# Altium project MiniEink 1.54寸墨水屏.PrjPcb
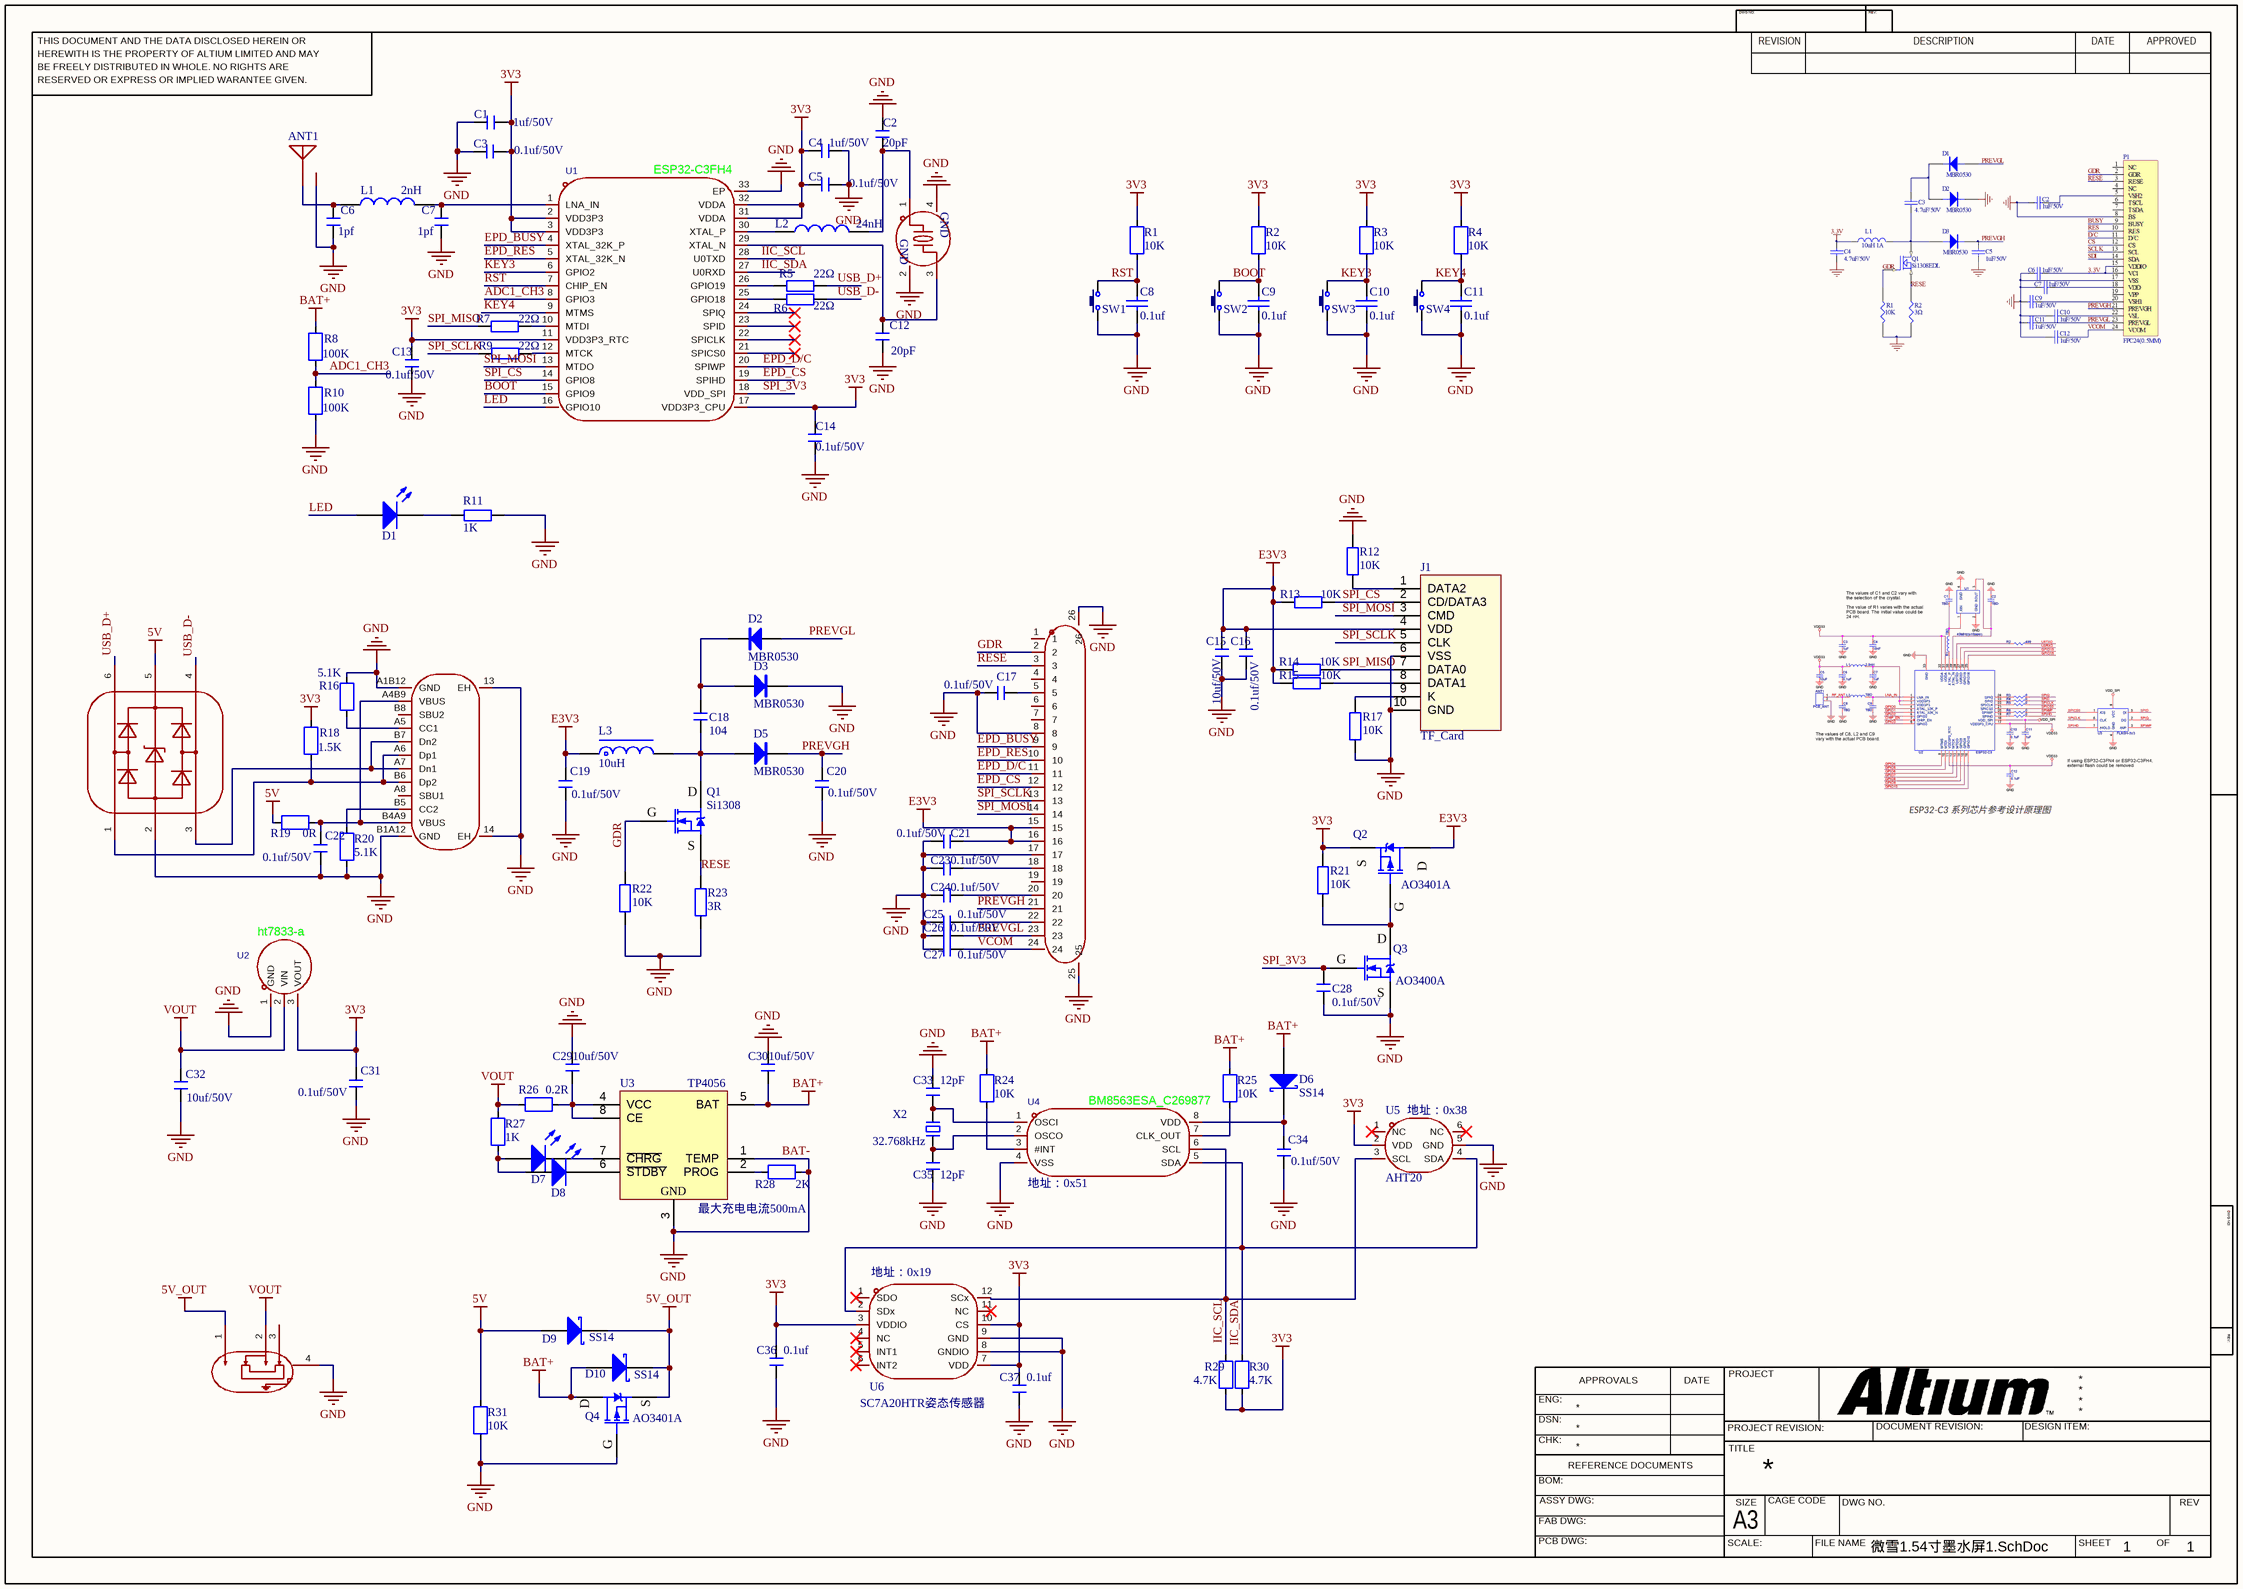
[diagram p0: 微雪1.54寸墨水屏1.SchDoc]
1 sheet, 102 parts. Net scope: global (net labels, ports and power ports of the same name join across sheets).
Board file: MiniEink 1.54寸墨水屏.PcbDoc

## Sheet 微雪1.54寸墨水屏1.SchDoc
size 420 x 297 mm; SheetNumber: 1; SheetTotal: 1

### Parts
ANT1  ANT2  [(my)ANT-F-1-2.4G-1.6mmFR4-WCH]  (value not drawn)
C1  1uf/50V  [C 0603_L]
C2  20pF  [C 0603_L]
C3  0.1uf/50V  [C 0603_L]
C4  1uf/50V  [C 0603_L]
C5  0.1uf/50V  [C 0603_L]
C6  1pf  [C 0603_L]
C7  1pf  [C 0603_L]
C8  value 0.1uf  [C 0603_L]  (hidden comment: 0.1uf/50V)
C9  value 0.1uf  [C 0603_L]  (hidden comment: 0.1uf/50V)
C10  value 0.1uf  [C 0603_L]  (hidden comment: 0.1uf/50V)
C11  value 0.1uf  [C 0603_L]  (hidden comment: 0.1uf/50V)
C12  20pF  [C 0603_L]
C13  0.1uf/50V  [C 0603_L]
C14  0.1uf/50V  [C 0603_L]
C15  10uf/50V  [C 0805_L]
C16  0.1uf/50V  [C 0603_L]
C17  0.1uf/50V  [C 0603_L]
C18  104  [C 0805_L]
C19  0.1uf/50V  [C 0603_L]
C20  0.1uf/50V  [C 0603_L]
C21  0.1uf/50V  [C 0603_L]
C22  0.1uf/50V  [C 0603_L]
C23  0.1uf/50V  [C 0603_L]
C24  0.1uf/50V  [C 0603_L]
C25  0.1uf/50V  [C 0603_L]
C26  0.1uf/50V  [C 0603_L]
C27  0.1uf/50V  [C 0603_L]
C28  0.1uf/50V  [C 0603_L]
C29  10uf/50V  [C 0805_L]
C30  10uf/50V  [C 0805_L]
C31  0.1uf/50V  [C 0603_L]
C32  10uf/50V  [C 0805_L]
C33  12pF  [C 0603_L]
C34  0.1uf/50V  [C 0603_L]
C35  12pF  [C 0603_L]
C36  0.1uf  [C 0603_L]
C37  0.1uf  [C 0603_L]
D1  LED  [LED 0603R]  (value not drawn)
D2  MBR0530  [SOD-123]
D3  MBR0530  [SOD-123]
D4  USBLC6-2SC6  [SOT23-6L]  (value not drawn)
D5  MBR0530  [SOD-123]
D6  SS14  [SOD-123F]
D7  LED  [LED 0603R]  (value not drawn)
D8  LED  [LED 0603G]  (value not drawn)
D9  SS14  [SOD-123F]
D10  SS14  [SOD-123F]
FPC1  FPC-05F-24PH20  [AFC07-S24ECA-00]  (value not drawn)
J1  TF_Card  [Micro SD 3D]
L1  2nH  [L 0603]
L2  24nH  [L 0603]
L3  10uH  [CD31]
Q1  Si1308  [SOT323]
Q2  AO3401A  [SOT23-3N]
Q3  AO3400A  [SOT23-3N]
Q4  AO3401A  [SOT23-3N]
R1  10K  [R 0603_L]
R2  10K  [R 0603_L]
R3  10K  [R 0603_L]
R4  10K  [R 0603_L]
R5  22Ω  [R 0603_L]
R6  22Ω  [R 0603_L]
R7  22Ω  [R 0603_L]
R8  100K  [R 0603_L]
R9  22Ω  [R 0603_L]
R10  100K  [R 0603_L]
R11  1K  [R 0805_L]
R12  10K  [R 0603_L]
R13  10K  [R 0603_L]
R14  10K  [R 0603_L]
R15  10K  [R 0603_L]
R16  5.1K  [R 0603_L]
R17  10K  [R 0603_L]
R18  1.5K  [R 0603_L]
R19  0R  [R 0603_L]
R20  5.1K  [R 0603_L]
R21  10K  [R 0603_L]
R22  10K  [R 0603_L]
R23  3R  [R 0805_L]
R24  10K  [R 0603_L]
R25  10K  [R 0603_L]
R26  0.2R  [R 0603_L]
R27  1K  [R 0603_L]
R28  2K  [R 0603_L]
R29  4.7K  [R 0603_L]
R30  4.7K  [R 0603_L]
R31  10K  [R 0603_L]
SW1  3x6x5  [TSW SMD-3*6*2.5]  (value not drawn)
SW2  3x6x5  [SW-SMD_L6.0-W6.0-LS6.6]  (value not drawn)
SW3  3x6x5  [SW-SMD_L6.0-W6.0-LS6.6]  (value not drawn)
SW4  3x6x5  [SW-SMD_L6.0-W6.0-LS6.6]  (value not drawn)
SW5  MSK12C02  [SW-TH_MSK12C02]  (value not drawn)
U1  ESP32-C3FH4  [QFN-32_L5.0-W5.0-P0.50-TL-EP3.7]
U2  ht7833-a  [SOT89_L]
U3  TP4056  [ESOP8_L]
U4  BM8563ESA_C269877  [SOP8_L]
U5  AHT20  [SENSOR-SMD_L3.0-W3.0-P1.00-BR]
U6  SC7A20HTR  [LGA-12_L2.0-W2.0-P0.50-TL]  (value not drawn)
USB1  TYPE-C 16PIN 2MD(073)  [USB-C-SMD_TYPE-C-16PIN-2MD-073]  (value not drawn)
X1  XL2EL89CPI-111YLC-40M  [SMD3225-4P]  (value not drawn)
X2  32.768kHz  [OSC 3215-2P]

### Nets
3V3: C1.2 C3.2 C4.1 C5.1 C13.2 C14.2 C31.2 C36.2 C37.2 Q2.2(S) R1.1 R2.1 R3.1 R4.1 R18.1 R21.2 R29.1 R30.2 U1.2(VDD3P3) U1.3(VDD3P3) U1.11(VDD3P3_RTC) U1.17(VDD3P3_CPU) U1.31(VDDA) U1.32(VDDA) U2.3(VOUT) U5.2(VDD) U6.3(VDDIO) U6.7(VDD) U6.10(CS)
5V: D4.5 D9.1(A) R19.2 R31.1
5V_OUT: D9.2(K) D10.2(K) Q4.2(S) SW5.1
BAT+: C30.1 D6.1(A) D10.1(A) Q4.3(D) R8.1 R24.1 R25.1 U3.5(BAT)
BAT-: ANT1.2 C1.1 C2.1 C3.1 C4.2 C5.2 C6.2 C7.2 C8.1 C9.1 C10.1 C11.1 C12.1 C13.1 C14.1 C15.2 C16.2 C17.2 C19.1 C20.1 C21.2 C22.1 C23.2 C24.2 C25.2 C26.2 C27.2 C28.2 C29.2 C30.2 C31.1 C32.1 C33.2 C34.1 C35.1 C36.1 C37.1 D3.2(K) D4.2 FPC1.8 FPC1.17 FPC1.25 FPC1.26 J1.6(VSS) J1.10(GND) Q3.3(S) Q4.1(G) R10.2 R11.2 R12.1 R16.1 R17.1 R20.1 R22.1 R23.1 R28.2 R31.2 SW1.1 SW2.1 SW3.1 SW4.1 SW5.4 U1.33(EP) U2.1(GND) U3.1(TEMP) U3.3(GND) U4.4(VSS) U5.5(GND) U6.8(GNDIO) U6.9(GND) USB1.13(EH) USB1.14(EH) USB1.A1B12(GND) USB1.B1A12(GND) X1.2(GND) X1.4(GND)  [also labelled GND]
E3V3: C15.1 C16.1 C19.2 C21.1 FPC1.15 FPC1.16 J1.4(VDD) L3.1 Q2.3(D) R13.2 R14.2 R15.1
VOUT: C32.2 R26.1 R27.2 SW5.2 U2.2(VIN)
ADC1_CH3: R8.2 R10.1 U1.8(GPIO3)
BOOT: C9.2 R2.2 SW2.2 U1.15(GPIO9)
EPD_BUSY: FPC1.9 U1.4(XTAL_32K_P)
EPD_CS: FPC1.12 U1.19(SPIHD)
EPD_D/C: FPC1.11 U1.20(SPIWP)
EPD_RES: FPC1.10 U1.5(XTAL_32K_N)
GDR: FPC1.2 Q1.1(G) R22.2
IIC_SCL: R29.2 U1.28(U0TXD) U4.6(SCL) U5.3(SCL) U6.12(SCx)
IIC_SDA: R30.1 U1.27(U0RXD) U4.5(SDA) U5.4(SDA) U6.2(SDx)
KEY3: C10.2 R3.2 SW3.2 U1.6(GPIO2)
KEY4: C11.2 R4.2 SW4.2 U1.9(MTMS)
LED: D1.1(A) U1.16(GPIO10)
PREVGH: C20.2 D5.2(K) FPC1.21
PREVGL: C26.1 D2.1(A) FPC1.23
RESE: FPC1.3 Q1.2(S) R23.2
RST: C8.2 R1.2 SW1.2 U1.7(CHIP_EN)
SPI_3V3: C28.1 Q3.1(G) U1.18(VDD_SPI)
SPI_CS: J1.2(CD/DATA3) R13.1 U1.14(GPIO8)
SPI_MISO: J1.7(DATA0) R7.2 R14.1
SPI_MOSI: FPC1.14 J1.3(CMD) U1.13(MTDO)
SPI_SCLK: FPC1.13 J1.5(CLK) R9.1
USB_D+: D4.6 R5.2
USB_D-: D4.4 R6.2
VCOM: C27.1 FPC1.24
NetANT1_1: ANT1.1(ANT) C6.1 L1.1
NetC2_2: C2.2 L2.2 X1.1
NetC7_1: C7.1 L1.2 U1.1(LNA_IN)
NetC12_2: C12.2 U1.29(XTAL_N) X1.3
NetC17_1: C17.1 FPC1.5
NetC18_1: C18.1 D5.1(A) L3.2 Q1.3(D)
NetC18_2: C18.2 D2.2(K) D3.1(A)
NetC22_2: C22.2 R19.1 USB1.A4B9(VBUS) USB1.B4A9(VBUS)
NetC23_1: C23.1 FPC1.18
NetC24_1: C24.1 FPC1.20
NetC25_1: C25.1 FPC1.22
NetC29_1: C29.1 R26.2 U3.4(VCC) U3.8(CE)
NetC33_1: C33.1 U4.1(OSCI) X2.1
NetC34_2: C34.2 D6.2(K) U4.8(VDD)
NetC35_2: C35.2 U4.2(OSCO) X2.2
NetD1_2: D1.2(K) R11.1
NetD4_1: D4.1 R18.2 USB1.A6(Dp1) USB1.B6(Dp2)
NetD4_3: D4.3 USB1.A7(Dn1) USB1.B7(Dn2)
NetD7_1: D7.1(A) D8.1(A) R27.1
NetD7_2: D7.2(K) U3.7(~{CHRG})
NetD8_2: D8.2(K) U3.6(~{STDBY})
NetJ1_1: J1.1(DATA2) R12.2
NetJ1_8: J1.8(DATA1) R15.2
NetJ1_9: J1.9(K) R17.2
NetL2_1: L2.1 U1.30(XTAL_P)
NetQ2_1: Q2.1(G) Q3.2(D) R21.1
NetR5_1: R5.1 U1.26(GPIO19)
NetR6_1: R6.1 U1.25(GPIO18)
NetR7_1: R7.1 U1.10(MTDI)
NetR9_2: R9.2 U1.12(MTCK)
NetR16_2: R16.2 USB1.A5(CC1)
NetR20_2: R20.2 USB1.B5(CC2)
NetR24_2: R24.2 U4.3(#INT)
NetR25_2: R25.2 U4.7(CLK_OUT)
NetR28_1: R28.1 U3.2(PROG)

Not connected (* = marked no-connect by the designer): FPC1 1 4 6 7 19; SW5 3; U1 21(SPICS0)* 22(SPICLK)* 23(SPID)* 24(SPIQ)*; U5 1(NC)* 6(NC)*; U6 1(SDO)* 4(NC)* 5(INT1)* 6(INT2)* 11(NC)*; USB1 A8(SBU1) B8(SBU2)

### Notes on the sheet
- (near U5) 地址：0x38
- (near U4) 地址：0x51
- (near U3) 最大充电电流500mA
- (near U6) 地址：0x19
- (near U6) SC7A20HTR姿态传感器
- THIS DOCUMENT AND THE DATA DISCLOSED HEREIN OR
- HEREWITH IS THE PROPERTY OF ALTIUM LIMITED AND MAY
- DWG NO:
- REVISION
- REV:
- DESCRIPTION
- DATE
- APPROVED
- BE FREELY DISTRIBUTED IN WHOLE. NO RIGHTS ARE
- RESERVED OR EXPRESS OR IMPLIED WARANTEE GIVEN.
- ENG:
- APPROVALS
- PROJECT
- DSN:
- CHK:
- REFERENCE DOCUMENTS
- PROJECT REVISION:
- TITLE
- DOCUMENT REVISION:
- DESIGN ITEM:
- BOM:
- FAB DWG:
- PCB DWG:
- ASSY DWG:
- SCALE:
- A3
- SIZE
- CAGE CODE
- FILE NAME
- DWG NO.
- SHEET
- OF
- REV

### Library data of the parts
ANT1 = ANT2: PCB板载天线带馈线; pin to pad: 2>0
C1 C3-C7 C13 C14 = CBB: 3010200396  (y)50V-474K电容/贴片/SMD0603; BOM名称: CBB电容; 淘宝ID: 封装库来自淘宝 ID：黄晶宝石; 联系售后: https://shop463601444.taobao.com
C2 C12 C18 C33 C35-C37 = C: 贴片电容; BOM名称: 无极性贴片电容; 淘宝ID: 封装库来自淘宝 ID：黄晶宝石; 联系售后，技术支持: https://shop463601444.taobao.com; 唯一出售店铺网址: https://shop463601444.taobao.com
C8-C11 = Capacitor: SimulationGenericComponent: True
C15-C17 C19-C31 C34 = CBB: CBB电容; 淘宝ID: 封装库来自淘宝 ID：黄晶宝石; BOM名称: CBB电容; 联系售后: https://shop463601444.taobao.com
C32 = CBB: 3010200430 (y)25V-106K电容/贴片/SMD0603; BOM名称: CBB电容; 淘宝ID: 封装库来自淘宝 ID：黄晶宝石; 联系售后: https://shop463601444.taobao.com
D1 D7 D8 = LED: 发光二极管; 技术支持，联系售后: https://shop463601444.taobao.com
D2 D3 D5 = M7: 整流二极管; 版权归属: 封装库来自淘宝 ID：黄晶宝石; BOM名称: 整流二极管; 学习资源: https://shop463601444.taobao.com
D6 = SS14: 肖特基二极管; 属性: 40V/1A; BOM名称: 肖特基二极管; 封装库来自淘宝 ID：黄晶宝石: https://shop463601444.taobao.com
D9 D10 = SS34: 肖特基二极管; 属性: 40V/3A; BOM名称: 肖特基二极管; 封装库来自淘宝 ID：黄晶宝石: https://shop463601444.taobao.com
J1 = TF_Card: TF卡座; BOM名称: TF卡座; 学习资源: https://shop463601444.taobao.com
L1 L2 = L: 小功率贴片电感; 淘宝ID: 封装库来自淘宝 ID：黄晶宝石; 封装库来自淘宝卖家 ID：黄晶宝石: 其他店铺购入均为盗版，不享受售后技术支持服务，请立即申请退款; BOM名称: 小功率贴片电感; 联系售后: https://shop463601444.taobao.com
L3 = L-SMD: CD系列贴片线绕功率电感; BOM名称: 功率电感; 淘宝ID: 封装库来自淘宝 ID：黄晶宝石; 学习资源: www.ooocke.com
Q1 = SI2302: N沟道场效应管; 技术支持，联系售后: 封装库来自淘宝 ID：黄晶宝石; BOM名称: N沟道场效应管; 学习资源: https://shop463601444.taobao.com
Q2 Q4 = SI2301: P沟道场效应管; 技术支持，联系售后: 封装库来自淘宝 ID：黄晶宝石; BOM名称: P沟道场效应管; 学习资源: https://shop463601444.taobao.com
Q3 = IRF840: N沟场效应管; BOM名称: N沟场效应管; 技术支持，联系售后: https://shop463601444.taobao.com
R1-R4 R8 R10 R16 R18-R20 R31 = Res2: 电阻，SMD，1/8W; Value: 1K; 精度: 5%; 特殊要求: [无铅]; ROOM: 手柄供电; Published: 8-Jun-2000; LatestRevisionDate: 17-Jul-2002; LatestRevisionNote: Re-released for DXP Platform.; PackageReference: AXIAL-0.4; Publisher: Altium Limited
R5-R7 R9 R11-R15 R17 R21-R23 = R: 贴片电阻; 版权归属: 来自淘宝 ID：黄晶宝石; 封装库来自淘宝卖家 ID：黄晶宝石: 其他店铺购入均为盗版，不享受售后技术支持服务，请立即申请退款; BOM名称: 贴片电阻; 联系售后: https://shop463601444.taobao.com
R24-R26 = Res2: 30101352 (y)SMD0603  1/10W1MΩ电阻器（无铅）; Value: 1K; 精度: 5%; 特殊要求: [无铅]; ROOM: 手柄供电; Published: 8-Jun-2000; LatestRevisionDate: 17-Jul-2002; LatestRevisionNote: Re-released for DXP Platform.; PackageReference: AXIAL-0.4; Publisher: Altium Limited
R27 = Res2: 30101352 (y)SMD0603  1/10W1MΩ电阻器（无铅）; 精度: 5%; 特殊要求: [无铅]; ROOM: 手柄供电; Published: 8-Jun-2000; LatestRevisionDate: 17-Jul-2002; LatestRevisionNote: Re-released for DXP Platform.; PackageReference: AXIAL-0.4; Publisher: Altium Limited; Value: 1K
R28-R30 = Res2: Value: 1K; 精度: 5%; 特殊要求: [无铅]; ROOM: 手柄供电; Published: 8-Jun-2000; LatestRevisionDate: 17-Jul-2002; LatestRevisionNote: Re-released for DXP Platform.; PackageReference: AXIAL-0.4; Publisher: Altium Limited
SW1-SW4 = TSW 3x6: 30105201 3×6×2.5轻触开关（贴片加边带）; BOM名称: 3x6轻触开关; 版权归属: 封装库来自淘宝 ID：黄晶宝石; 学习资源: https://shop463601444.taobao.com
U2 = ht7833-a: 输出极性:正极;工作电压:12V;输出电压:3.3V;输出电流:450mA;电源纹波抑制比(PSRR):-;输出类型:固定;; Manufacturer: UMW(友台半导体); AddInBom: yes; ModelId: 6db690b7897d4d18a30d90c1b89525ee; ModelName: SOT-89-3_L4.3-W2.5-H1.6-LS4.1-P1.50; ModelTransform: 161.417,169.291,0,180,0,0,-12.745,0.006,0; Output Configuration: 正极; Voltage - Supply: 12V; Output Voltage: 3.3V; Output Current: 450mA; Voltage Dropout: 90mV@(40mA); standby current: 2uA; Output Type: 固定; Number of Outputs: 1; Symbol: HT7833-A; LCSC Part Name: 3.3V 450mA 12V; SupplierPart: C347195; ManufacturerPart: HT7833-A; Supplier Footprint: SOT-89; JLCPCB Part Class: Extended Part; Datasheet: https://item.szlcsc.com/datasheet/HT7833-A/323855.html; Supplier: LCSC; ConvertToPcb: yes; FootprintName: SOT-89_L4.5-W2.5-P1.50-LS4.2-BR; Power Supply Rejection Ratio (PSRR): -; Noise: -; Features: 热关断; Operating Temperature: -25℃~+70℃@(Ta)
U3 = TP4056: 锂电池充电管理
U4 = BM8563ESA_C269877: 高精度、低功耗 I2C 接口实时时钟/日历; Symbol: BM8563ESA_C269877
U5 = AHT20_C2757850AHT20_C2757850: AHT20温湿度传感器
U6 = SC7A20HTR: ±2G/±4G/±8G/±16G三轴微机械数字加速度计
X1 = XL2EL89CPI-111YLC-40M: SMD3225-4P; Symbol: XL2EL89CPI-111YLC-40M
X2 = XTAL-2P: 2脚无源脚晶振; 版权归属: 封装库来自淘宝卖家 ID：黄晶宝石; BOM名称: 2脚无源脚晶振; 学习资源: https://shop463601444.taobao.com
D4 = USBLC6-2SC6: Symbol: USBLC6-2SC6
FPC1 = FPC-05F-24PH20: Symbol: FPC-05F-24PH20
SW5 = MSK12C02: Symbol: MSK12C02
U1 = ESP32-C3FH4: Symbol: ESP32-C3FH4
USB1 = TYPE-C 16PIN 2MD(073): Symbol: TYPE-C 16PIN 2MD(073)